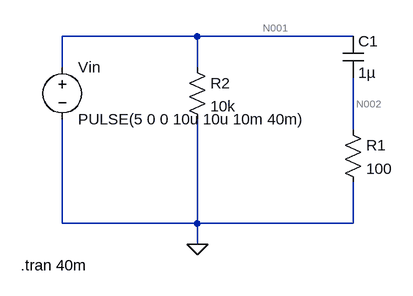
[diagram p0: schematic lab1_2.asc]
lab1_2.asc, the LTspice schematic file:
Version 4.1
SHEET 1 880 680
WIRE 128 48 -80 48
WIRE 368 48 128 48
WIRE -80 96 -80 48
WIRE 128 96 128 48
WIRE 368 192 368 112
WIRE -80 336 -80 176
WIRE 128 336 128 176
WIRE 128 336 -80 336
WIRE 368 336 368 272
WIRE 368 336 128 336
WIRE 128 368 128 336
FLAG 128 368 0
SYMBOL cap 352 48 R0
SYMATTR InstName C1
SYMATTR Value 1µ
SYMBOL res 352 176 R0
SYMATTR InstName R1
SYMATTR Value 100
SYMBOL res 112 80 R0
SYMATTR InstName R2
SYMATTR Value 10k
SYMBOL voltage -80 80 R0
WINDOW 123 0 0 Left 0
WINDOW 39 0 0 Left 0
SYMATTR InstName Vin
SYMATTR Value PULSE(5 0 0 10u 10u 10m 40m)
TEXT -144 400 Left 2 !.tran 40m

The netlist it stands for:
* lab1_2.asc
C1 N001 N002 1µ
R1 N002 0 100
R2 N001 0 10k
Vin N001 0 PULSE(5 0 0 10u 10u 10m 40m)
.tran 40m
.backanno
.end

* Results of the author's LTspice run, read from the files saved beside the schematic
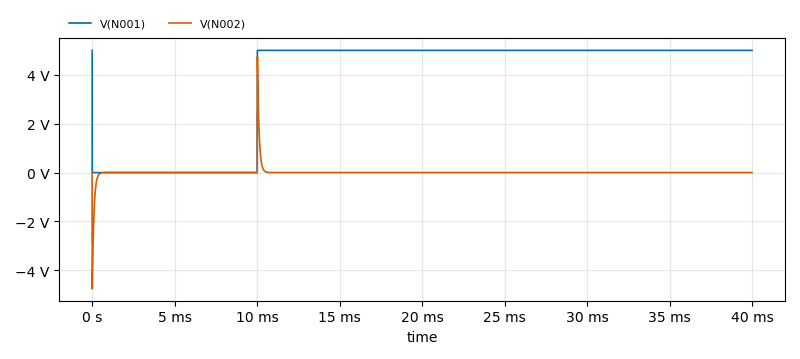
[diagram p1: Transient Analysis of lab1_2.asc, plotted from the saved traces]
* Transient Analysis, 1 run:
*   V(N001): min 0 V, max 5 V, average 3.749 V, rms 4.329 V, last 5 V
*   V(N002): min -4.758 V, max 4.759 V, average -2.15 µV, rms 249 mV, last 0 V